# EasyEDA Pro project TMI7003C_TEST.eprj

# Schematic Schematic1

## Sheets
1 P1: Board Name: Board1; Create Date: 2025-01-24; Page Name: P1; Project Name: TMI7003C_TEST; Schematic Name: Schematic1; Update Date: 2025-01-25; Company: 嘉立创EDA; Page Size: A4; Version: V1.0
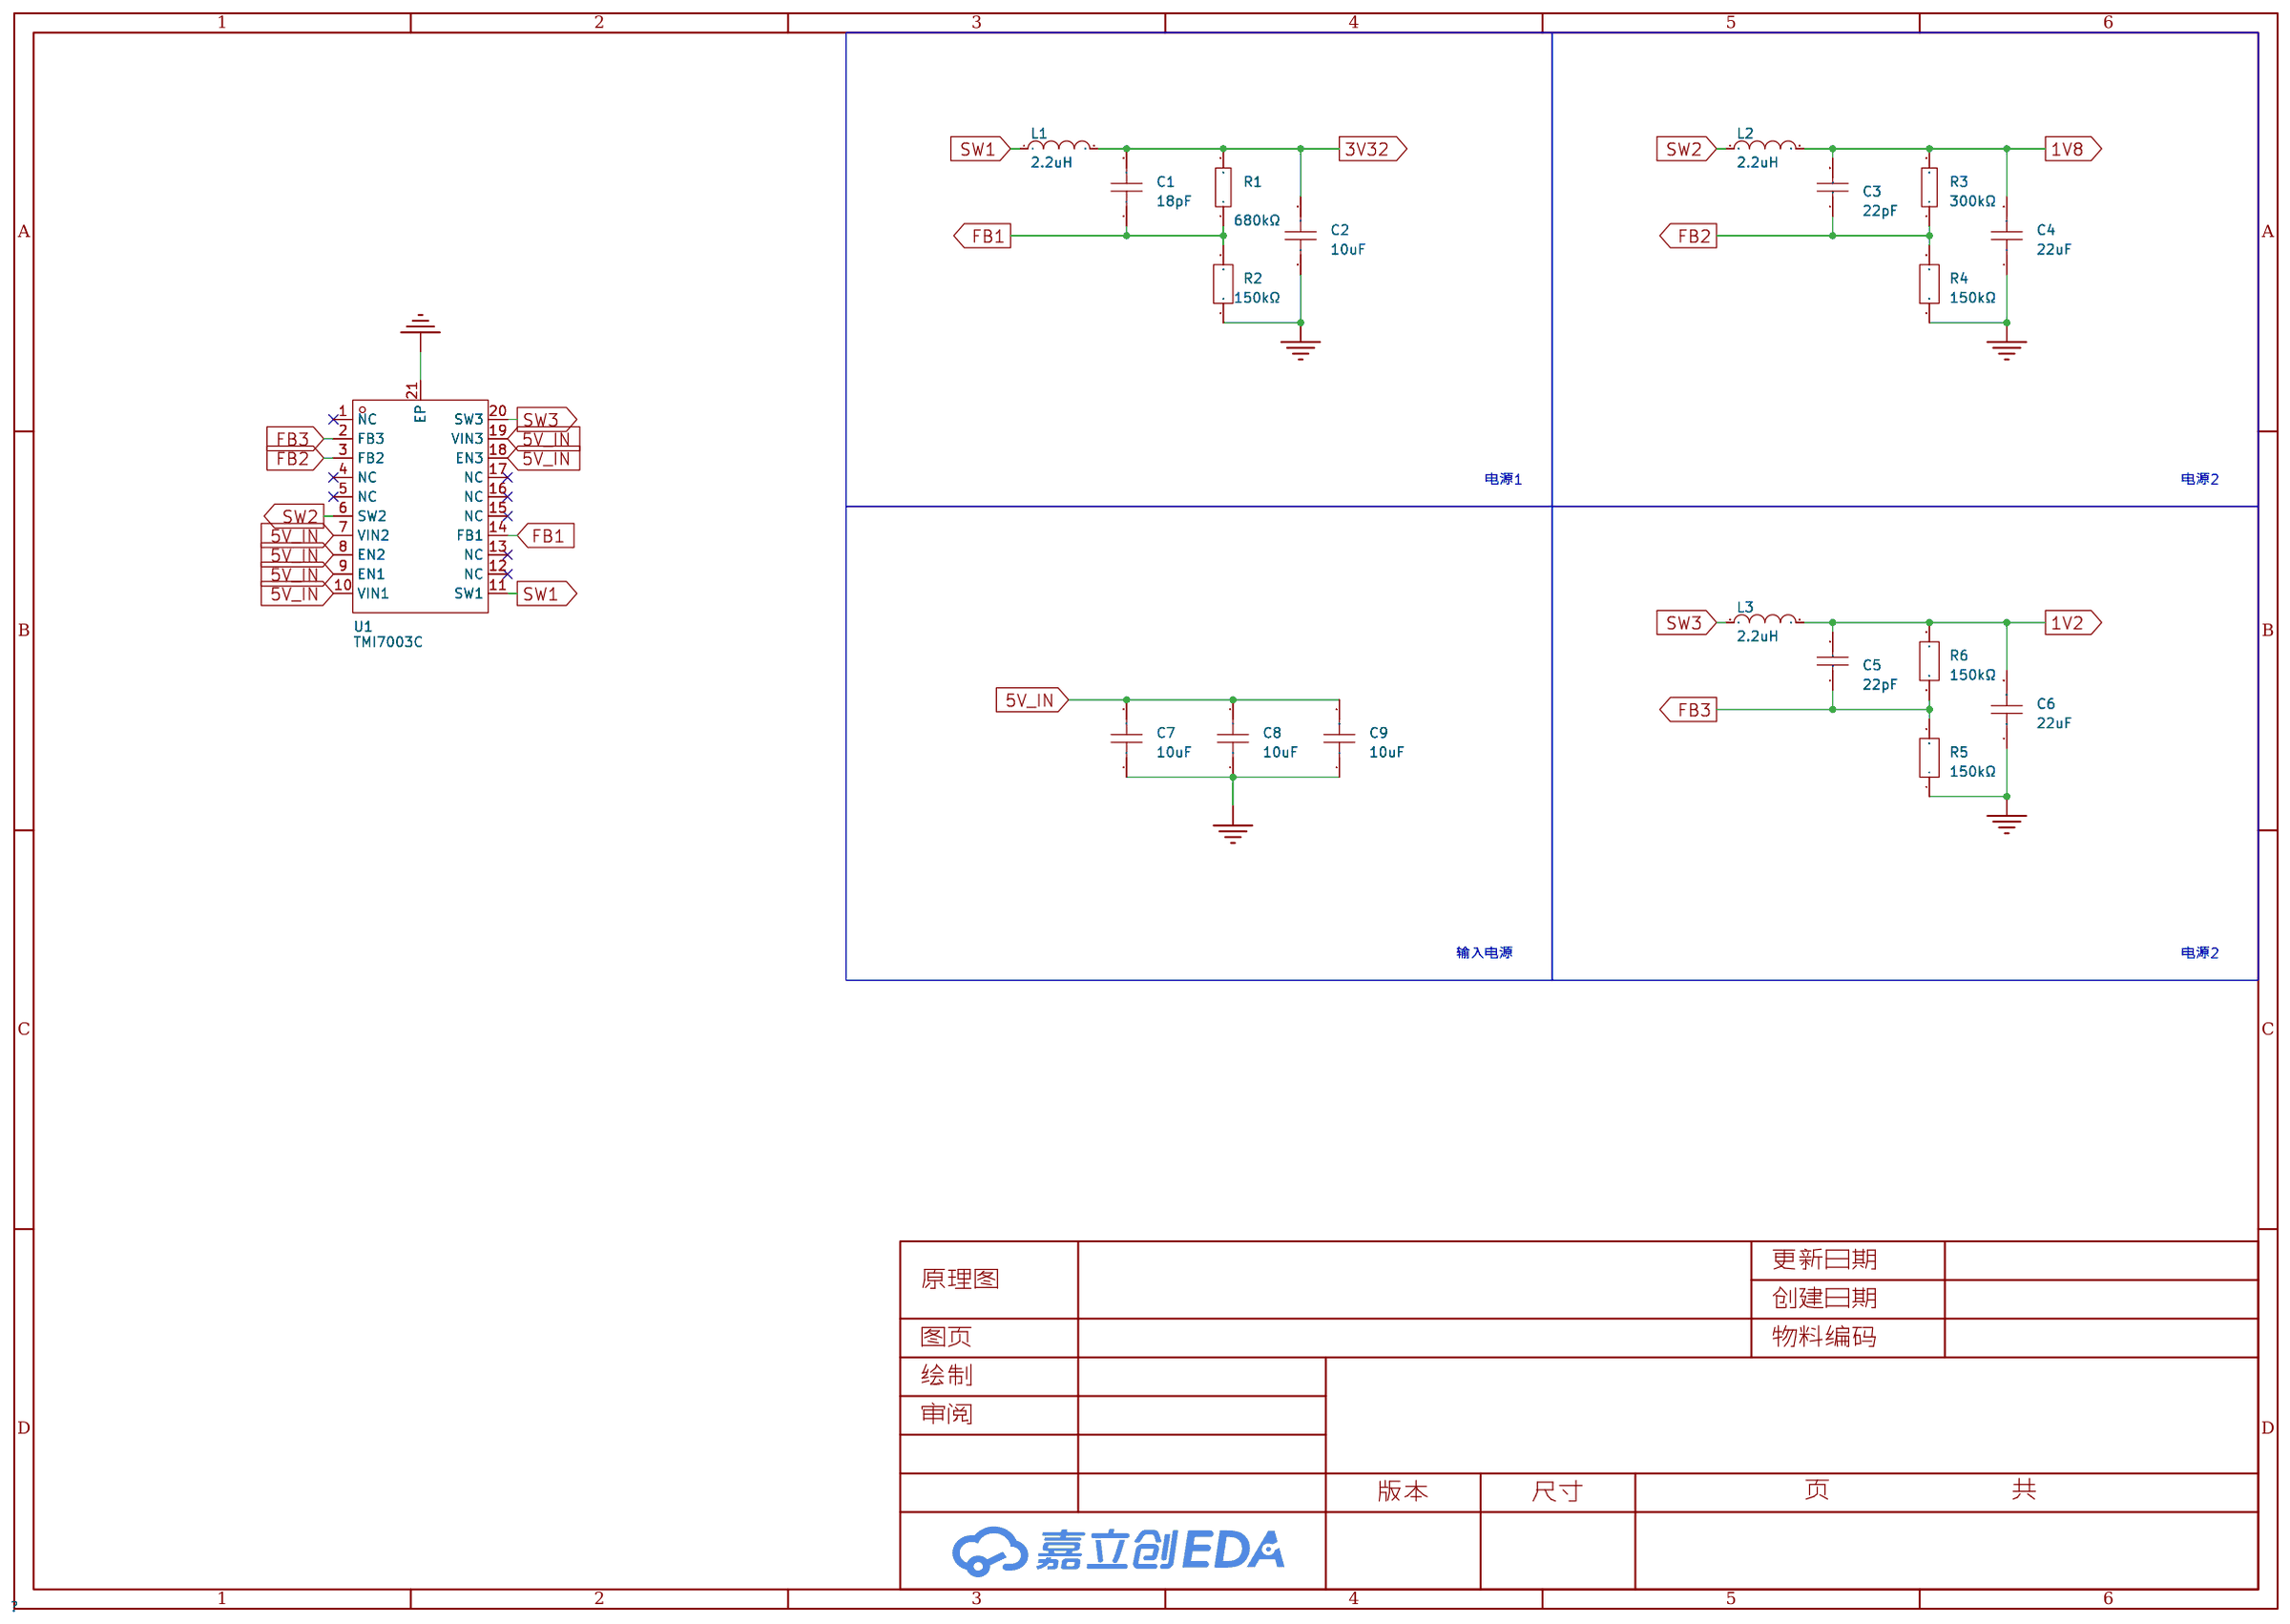
[diagram p0: P1]
2 P2: Create Date: 2025-01-25; Page Name: P2
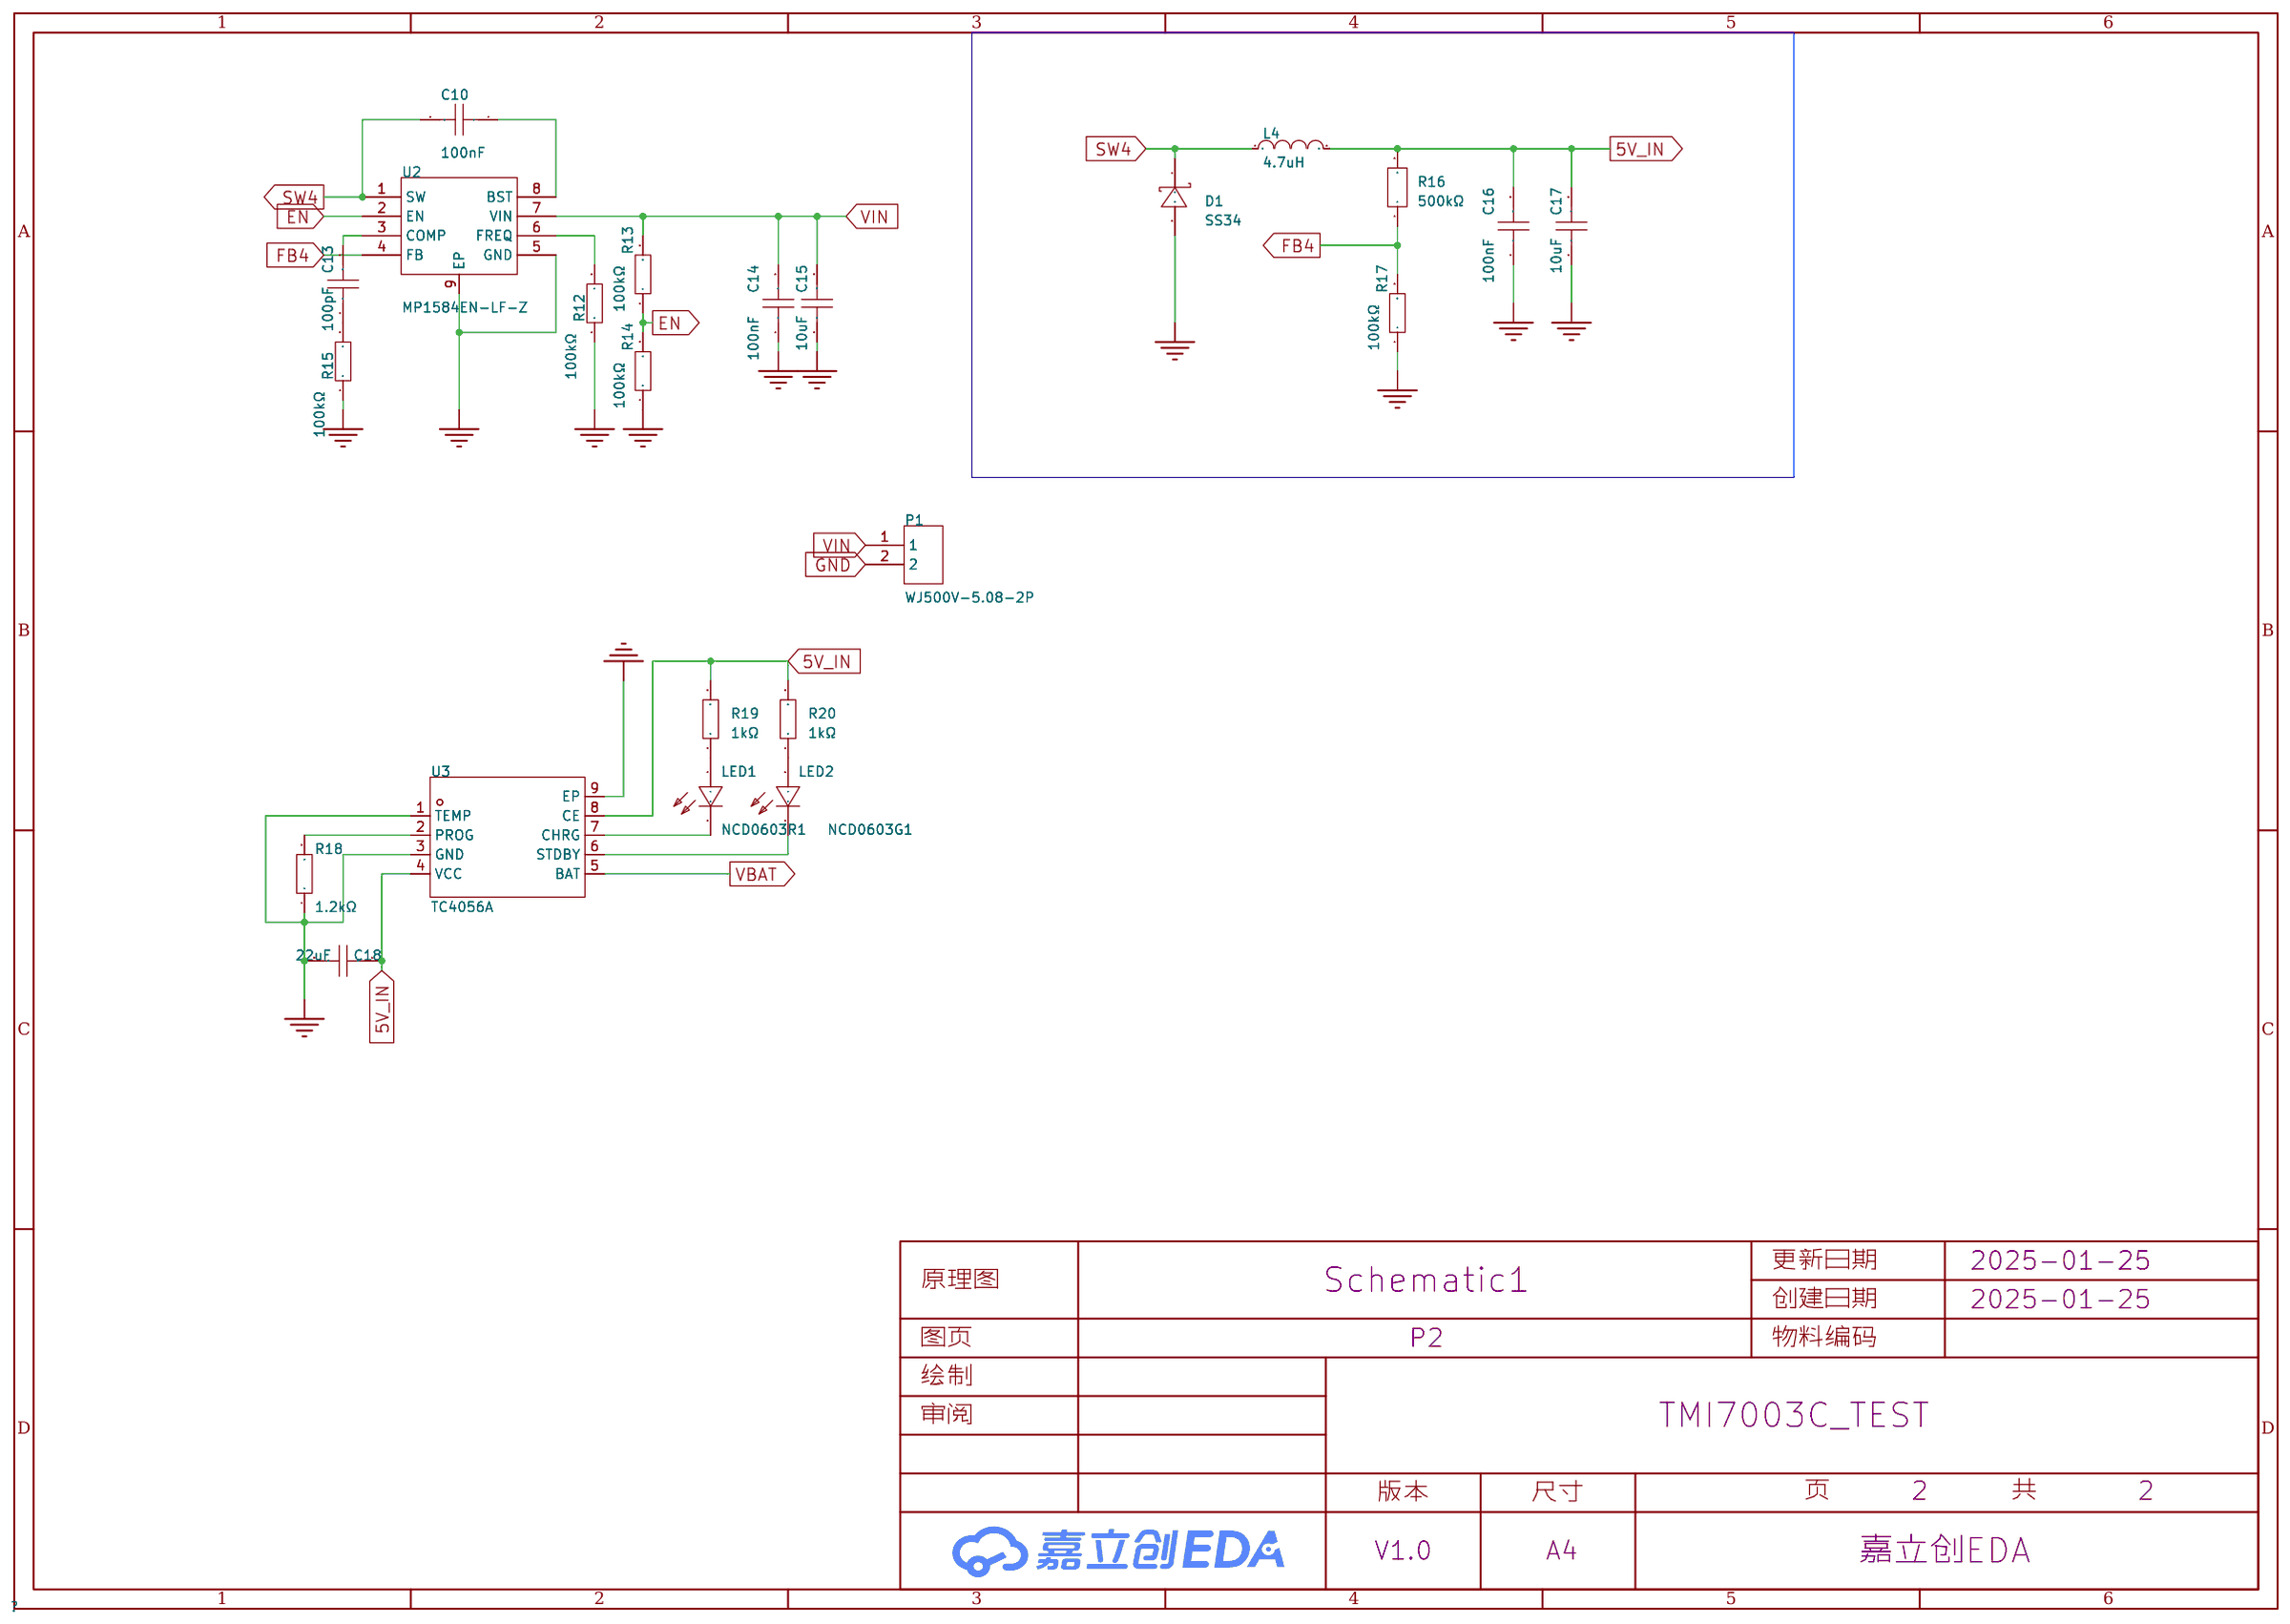
[diagram p1: P2]

## Parts
sheet P1
C1  18pF  [C0603]
C2  10uF  [C0603]
C3  22pF  [C0603]
C4  22uF  [C0805]
C5  22pF  [C0603]
C6  22uF  [C0805]
C7  10uF  [C0603]
C8  10uF  [C0603]
C9  10uF  [C0603]
L1  2.2uH  [IND-SMD_L2.5-W2.0_MHCHL2520]
L2  2.2uH  [IND-SMD_L2.5-W2.0_MHCHL2520]
L3  2.2uH  [IND-SMD_L2.5-W2.0_MHCHL2520]
R1  680kΩ  [R0603]
R2  150kΩ  [R0603]
R3  300kΩ  [R0603]
R4  150kΩ  [R0603]
R5  150kΩ  [R0603]
R6  150kΩ  [R0603]
U1  TMI7003C  [QFN-20_L3.0-W3.0-P0.40-BL-EP1.9]
sheet P2
C10  100nF  [C0603]
C13  100pF  [C0603]
C14  100nF  [C0603]
C15  10uF  [C0603]
C16  100nF  [C0603]
C17  10uF  [C0603]
C18  22uF  [C0805]
D1  SS34  [SMA_L4.3-W2.6-LS5.2-RD]
L4  4.7uH  [IND-SMD_L5.4-W5.2_FXL0530]
LED1  NCD0603R1  [LED0603-RD_RED]
LED2  NCD0603G1  [LED0603-RD_1]
P1  WJ500V-5.08-2P  [CONN-TH_2P-P5.00_WJ500V-5.08-2P]
R12  100kΩ  [R0603]
R13  100kΩ  [R0603]
R14  100kΩ  [R0603]
R15  100kΩ  [R0603]
R16  500kΩ  [R0603]
R17  100kΩ  [R0603]
R18  1.2kΩ  [R0603]
R19  1kΩ  [R0603]
R20  1kΩ  [R0603]
U2  MP1584EN-LF-Z  [SOIC-8_L5.0-W4.0-P1.27-LS6.0-BL-EP2.0]
U3  TC4056A  [ESOP-8_L4.9-W3.9-P1.27-LS6.0-BR-EP3.3]

## Library data of the parts
C1 = FCC0603N180J500CT: 容值:18pF;精度:±5%;额定电压:50V;材质(温度系数):C0G;; LCSC Part Name: 18pF ±5% 50V; Supplier Part: C5137620; Manufacturer: FOJAN(富捷); Supplier Footprint: 0603; JLCPCB Part Class: 扩展库; Datasheet: https://atta.szlcsc.com/upload/public/pdf/source/20220818/0EB3B7FB2F5648AC16609637FBA7DABE.pdf; Supplier: LCSC; Tolerance: ±5%; Voltage Rated: 50V; Temperature Coefficient: C0G
C2 C7-C9 C15 C17 = CGA0603X5R106K100JT: 容值:10uF;精度:±10%;额定电压:10V;材质(温度系数):X5R;; LCSC Part Name: 10uF ±10% 10V; Supplier Part: C6119842; Manufacturer: HRE(芯声); Supplier Footprint: 0603; JLCPCB Part Class: 扩展库; Supplier: LCSC; Tolerance: ±10%; Voltage Rated: 10V; Temperature Coefficient: X5R
C3 = CC0603JRNPO9BN220: 容值:22pF;精度:±5%;额定电压:50V;材质(温度系数):NP0;; LCSC Part Name: 22pF ±5% 50V; Supplier Part: C105620; Manufacturer: YAGEO(国巨); Supplier Footprint: 0603; JLCPCB Part Class: 扩展库; Datasheet: https://atta.szlcsc.com/upload/public/pdf/source/20170505/1493957838062.pdf; Supplier: LCSC; Tolerance: ±5%; Voltage Rated: 50V; Temperature Coefficient: NP0
C4 C6 C18 = CGA0805X5R226M350MT: 容值:22uF;精度:±20%;额定电压:35V;材质(温度系数):X5R;; LCSC Part Name: 22uF ±20% 35V; Supplier Part: C6119901; Manufacturer: HRE(芯声); Supplier Footprint: 0805; JLCPCB Part Class: 扩展库; Datasheet: https://atta.szlcsc.com/upload/public/pdf/source/20231129/D589D0CC4D260F7AC3A77E53B455CCB3.pdf; Supplier: LCSC; Tolerance: ±20%; Voltage Rated: 35V; Temperature Coefficient: X5R
C5 = CC0603JRNPO9BN220: 容值:22pF;精度:±5%;额定电压:50V;材质(温度系数):NP0;; LCSC Part Name: 22pF ±5% 50V; Supplier Part: C105620; Manufacturer: YAGEO(国巨); Supplier Footprint: 0603; JLCPCB Part Class: Extended Part; Datasheet: https://atta.szlcsc.com/upload/public/pdf/source/20170505/1493957838062.pdf; Supplier: LCSC; Tolerance: ±5%; Voltage Rated: 50V; Temperature Coefficient: NP0
L1-L3 = FTC252012S2R2MBCA: 电感值:2.2uH;精度:±20%;额定电流:3A;饱和电流(Isat):3.8A;类型:一体成型电感;; LCSC Part Name: 2.2uH ±20% 3.8A; Supplier Part: C5832372; Manufacturer: cjiang(长江微电); Supplier Footprint: 1008; JLCPCB Part Class: 扩展库; Datasheet: https://atta.szlcsc.com/upload/public/pdf/source/20230602/8FFEDA9C0247A92A0D4B67554BFE4091.pdf; Supplier: LCSC; Tolerance: ±20%; Rated Current: 3A; Saturation Current (Isat): 3.8A; DC Resistance (DCR): 55mΩ; Type: 一体成型电感
R1 = 0603WAF6803T5E: 电阻类型:厚膜电阻;阻值:680kΩ;精度:±1%;功率:100mW;最大工作电压:75V;温度系数:±100ppm/℃;; LCSC Part Name: 680kΩ ±1% 100mW 厚膜电阻; Supplier Part: C25822; Manufacturer: UNI-ROYAL(厚声); Supplier Footprint: 0603; JLCPCB Part Class: 扩展库; Datasheet: https://atta.szlcsc.com/upload/public/pdf/source/20200306/C422600_1E6D84923E4A46A82E41ADD87F860B5C.pdf; Supplier: LCSC; Type: 厚膜电阻; Tolerance: ±1%; Power(Watts): 100mW; Overload Voltage (Max): 75V; Temperature Coefficient: ±100ppm/℃; Operating Temperature Range: -55℃~+155℃
R2 R4-R6 = FRC0603F1503TS: 电阻类型:厚膜电阻;阻值:150kΩ;精度:±1%;功率:100mW;最大工作电压:75V;温度系数:±100ppm/℃;; LCSC Part Name: 150kΩ ±1% 100mW 厚膜电阻; Supplier Part: C2906993; Manufacturer: FOJAN(富捷); Supplier Footprint: 0603; JLCPCB Part Class: 扩展库; Datasheet: https://atta.szlcsc.com/upload/public/pdf/source/20211221/925EC7D7225764EE0046F22065062C87.pdf; Supplier: LCSC; Type: 厚膜电阻; Tolerance: ±1%; Power(Watts): 100mW; Overload Voltage (Max): 75V; Temperature Coefficient: ±100ppm/℃; Operating Temperature Range: -55℃~+155℃
R3 = 0603WAF3003T5E: 电阻类型:厚膜电阻;阻值:300kΩ;精度:±1%;功率:100mW;最大工作电压:75V;温度系数:±100ppm/℃;; LCSC Part Name: 300kΩ ±1% 100mW 厚膜电阻; Supplier Part: C23024; Manufacturer: UNI-ROYAL(厚声); Supplier Footprint: 0603; JLCPCB Part Class: 基础库; Datasheet: https://atta.szlcsc.com/upload/public/pdf/source/20200306/C422600_1E6D84923E4A46A82E41ADD87F860B5C.pdf; Supplier: LCSC; Type: 厚膜电阻; Tolerance: ±1%; Power(Watts): 100mW; Overload Voltage (Max): 75V; Temperature Coefficient: ±100ppm/℃; Operating Temperature Range: -55℃~+155℃
U1 = TMI7003C: 功能类型:降压型;输出类型:-;工作电压:2.5V~5.5V;输出电压:-;输出电流:-;; LCSC Part Name: 3通道1.5A 1.5MHz同步降压电源管理IC; Supplier Part: C840566; Manufacturer: TMI(拓尔微); Supplier Footprint: QFN-20-EP(3x3); JLCPCB Part Class: 扩展库; Datasheet: https://atta.szlcsc.com/upload/public/pdf/source/20240902/914C742CD42C12243EC1254263C971AB.pdf; Supplier: LCSC; Function: 降压型; Input Voltage: 2.5V~5.5V; Switching Frequency: 1.5MHz; Operating Temperature: -40℃~+125℃; Topology: 降压式
C10 C14 C16 = CGA0603X7R104K500JT: 容值:100nF;精度:±10%;额定电压:50V;材质(温度系数):X7R;; LCSC Part Name: 100nF ±10% 50V; Supplier Part: C6119867; Manufacturer: HRE(芯声); Supplier Footprint: 0603; JLCPCB Part Class: 扩展库; Supplier: LCSC; Tolerance: ±10%; Voltage Rated: 50V; Temperature Coefficient: X7R
C13 = CC0603JRNPO9BN101: 容值:100pF;精度:±5%;额定电压:50V;材质(温度系数):NP0;; LCSC Part Name: 100pF ±5% 50V; Supplier Part: C14665; Manufacturer: YAGEO(国巨); Supplier Footprint: 0603; JLCPCB Part Class: 扩展库; Datasheet: https://atta.szlcsc.com/upload/public/pdf/source/20181008/C309499_21CC21451B82C39E3D92150FD6B30293.pdf; Supplier: LCSC; Tolerance: ±5%; Voltage Rated: 50V; Temperature Coefficient: NP0
D1 = SS34_C8678: 二极管配置:独立式;正向压降(Vf):550mV@3A;直流反向耐压(Vr):40V;整流电流:3A;; LCSC Part Name: 电压:40V 电流:3A; Supplier Part: C8678; Manufacturer: MDD(辰达半导体); Supplier Footprint: SMA(DO-214AC); JLCPCB Part Class: 基础库; Datasheet: https://atta.szlcsc.com/upload/public/pdf/source/20240710/2118BB86FDDB2E0B294389AC1F3F65C8.pdf; Supplier: LCSC; Diode Configuration: 独立式; Forward Voltage (Vf@If): 550mV@3A; Reverse Voltage (Vr): 40V; Rectified Current: 3A; Reverse Leakage Current (Ir): 500uA@40V
L4 = FXL0530-4R7-M: 电感值:4.7uH;精度:±20%;额定电流:4.5A;饱和电流(Isat):5A;类型:一体成型电感;; LCSC Part Name: 4.7uH ±20% 5A; Supplier Part: C177246; Manufacturer: cjiang(长江微电); Supplier Footprint: SMD,5.2x5.4mm; JLCPCB Part Class: 扩展库; Datasheet: https://atta.szlcsc.com/upload/public/pdf/source/20240426/3189EA8206330E2108542F9E34E540E7.pdf; Supplier: LCSC; Tolerance: ±20%; Rated Current: 4.5A; Saturation Current (Isat): 5A; DC Resistance (DCR): 60mΩ; Type: 一体成型电感
LED1 = NCD0603R1_C84263: 灯头类型:-;发光颜色:红色;正向电压(VF):1.6V~2.6V;功率:65mW;正向电流:20mA;主波长:615nm~630nm;二极管配置:独立二极管;透镜颜色:无色透明透镜;色温:-;发光强度:80mcd~220mcd;发光角度:130°;载带方式:-;工作温度:-30℃~+85℃;; Supplier Part: C84263; Manufacturer: 国星光电; Supplier Footprint: 0603; JLCPCB Part Class: 扩展库; Datasheet: https://atta.szlcsc.com/upload/public/pdf/source/20200820/C84263_DABC6A75E58F576973B407FDBA283D60.pdf; Supplier: LCSC; Emitted Color: 红色; Forward Voltage (VF): 1.6V~2.6V; Power Dissipation: 65mW; Forward Current: 20mA; Dominant Wavelength: 615nm~630nm; Diode Configuration: 独立二极管; Lens Color: 无色透明透镜; Luminous Intensity: 80mcd~220mcd; Viewing Angle: 130°; Operating Temperature: -30℃~+85℃
LED2 = NCD0603G1: 发光颜色:翠绿色;正向电压(VF):2.6V~3.6V;功率:72mW;正向电流:10mA;主波长:515nm~530nm;透镜颜色:无色透明透镜;发光强度:330mcd~900mcd;发光角度:130°;工作温度:-30℃~+85℃;; Supplier Part: C84267; Manufacturer: 国星光电; Supplier Footprint: 0603; JLCPCB Part Class: 扩展库; Datasheet: https://atta.szlcsc.com/upload/public/pdf/source/20200820/C84267_04BA7703640BAC111D09F5EFB971FBF3.pdf; Supplier: LCSC; Emitted Color: 翠绿色; Forward Voltage (VF): 2.6V~3.6V; Power Dissipation: 72mW; Forward Current: 10mA; Dominant Wavelength: 515nm~530nm; Lens Color: 无色透明透镜; Luminous Intensity: 330mcd~900mcd; Viewing Angle: 130°; Operating Temperature: -30℃~+85℃
P1 = WJ500V-5.08-2P: 结构:1x2P;间距:5.08mm;颜色:绿色;安装方式:直插;额定电流:18A;额定电压:250V;排数:1;线规 - AWG:14~30;线规 - 平方毫米:2.5;每排PIN数:2;触头材质:-;触头镀层:-;工作温度范围:-40℃~+105℃;焊接温度(最大值):-;; LCSC Part Name: 1x2P 5.08mm 直插 排数:1 每排P数:2; Supplier Part: C8465; Manufacturer: KANGNEX(康奈克斯电气); Supplier Footprint: 插件,P=5.08mm; JLCPCB Part Class: 扩展库; Datasheet: https://atta.szlcsc.com/upload/public/pdf/source/20191225/C8465_02D34CE5B5B4A53DF5891601D97FA9F4.pdf; Supplier: LCSC; Structure: 1x2P; Pitch: 5.08mm; Color: 绿色; Mounting Style: 直插; Current Rating (Max): 18A; Voltage Rating (Max): 250V; Number of Pins: 2P; Number of Rows: 1; Wire Gauge - AWG: 14~30; Wire Gauge - mm2: 2.5; Number of PINs Per Row: 2; Operating Temperature Range: -40℃~+105℃; Screw Specification: M2.5
R12-R15 R17 = 0603WAF1003T5E: 电阻类型:厚膜电阻;阻值:100kΩ;精度:±1%;功率:100mW;最大工作电压:75V;温度系数:±100ppm/℃;; LCSC Part Name: 100kΩ ±1% 100mW 厚膜电阻; Supplier Part: C25803; Manufacturer: UNI-ROYAL(厚声); Supplier Footprint: 0603; JLCPCB Part Class: 基础库; Datasheet: https://atta.szlcsc.com/upload/public/pdf/source/20200306/C422600_1E6D84923E4A46A82E41ADD87F860B5C.pdf; Supplier: LCSC; Type: 厚膜电阻; Tolerance: ±1%; Power(Watts): 100mW; Overload Voltage (Max): 75V; Temperature Coefficient: ±100ppm/℃; Operating Temperature Range: -55℃~+155℃
R16 = AR03BTC5003N: 阻值:500kΩ;精度:±0.1%;功率:62.5mW;温度系数:±25ppm/℃;; LCSC Part Name: 500kΩ ±0.1% 62.5mW; Supplier Part: C412382; Manufacturer: Viking(光颉); Supplier Footprint: 0603; JLCPCB Part Class: 扩展库; Datasheet: https://atta.szlcsc.com/upload/public/pdf/source/20191129/C465721_10D49275DB41E427863CE9C8D788770A.pdf; Supplier: LCSC; Tolerance: ±0.1%; Power(Watts): 62.5mW; Temperature Coefficient: ±25ppm/℃
R18 = 0603WAF1201T5E: 电阻类型:厚膜电阻;阻值:1.2kΩ;精度:±1%;功率:100mW;最大工作电压:75V;温度系数:±100ppm/℃;; LCSC Part Name: 1.2kΩ ±1% 100mW 厚膜电阻; Supplier Part: C22765; Manufacturer: UNI-ROYAL(厚声); Supplier Footprint: 0603; JLCPCB Part Class: 基础库; Datasheet: https://atta.szlcsc.com/upload/public/pdf/source/20200306/C422600_1E6D84923E4A46A82E41ADD87F860B5C.pdf; Supplier: LCSC; Type: 厚膜电阻; Tolerance: ±1%; Power(Watts): 100mW; Overload Voltage (Max): 75V; Temperature Coefficient: ±100ppm/℃; Operating Temperature Range: -55℃~+155℃
R19 R20 = 0603WAF1001T5E: 电阻类型:厚膜电阻;阻值:1kΩ;精度:±1%;功率:100mW;最大工作电压:75V;温度系数:±100ppm/℃;; LCSC Part Name: 1kΩ ±1% 100mW 厚膜电阻; Supplier Part: C21190; Manufacturer: UNI-ROYAL(厚声); Supplier Footprint: 0603; JLCPCB Part Class: 基础库; Datasheet: https://atta.szlcsc.com/upload/public/pdf/source/20200306/C422600_1E6D84923E4A46A82E41ADD87F860B5C.pdf; Supplier: LCSC; Type: 厚膜电阻; Tolerance: ±1%; Power(Watts): 100mW; Overload Voltage (Max): 75V; Temperature Coefficient: ±100ppm/℃; Operating Temperature Range: -55℃~+155℃
U2 = MP1584EN-LF-Z: 功能类型:降压型;输出类型:固定;工作电压:4.5V~28V;输出电压:800mV~25V;输出电流:3A;; LCSC Part Name: 3A、1.5MHz、28V降压转换器; Supplier Part: C15051; Manufacturer: MPS(芯源); Supplier Footprint: SOIC-8-EP; JLCPCB Part Class: 扩展库; Datasheet: https://atta.szlcsc.com/upload/public/pdf/source/20240315/437CA6FCECC7F1E554266F7D3B71CA0D.pdf; Supplier: LCSC; Function: 降压型; Output Type: 固定; Input Voltage: 4.5V~28V; Output Voltage: 800mV~25V; Output Current: 3A; Switching Frequency: 100kHz~1.5MHz; Operating Temperature: -20℃~+125℃; Synchronous Rectification: 否; Number of Outputs: 1; Topology: 降压式; Quiescent Current (Iq): 100uA; Switch tube (built-in/external): 内置
U3 = TC4056A: 锂电池1A充电; LCSC Part Name: A档; Supplier Part: C84051; Manufacturer: FM(富满); Supplier Footprint: SOP-8-EP; JLCPCB Part Class: 扩展库; Datasheet: https://atta.szlcsc.com/upload/public/pdf/source/20241210/75A3BB1B55B92B4C46ED3BBA4FF28CC0.pdf; Supplier: LCSC

## Nets
1V2: C5.2 C6.2 L3.2 R6.2
1V8: C3.2 C4.2 L2.2 R3.2
3V32: C1.2 C2.2 L1.2 R1.2
5V_IN: C7.2 C8.2 C9.2 C16.2 C17.2 C18.1 L4.2 R16.2 R19.2 R20.2 U1.7(VIN2) U1.8(EN2) U1.9(EN1) U1.10(VIN1) U1.18(EN3) U1.19(VIN3) U3.4(VCC) U3.8(CE)
GND: C2.1 C4.1 C6.1 C7.1 C8.1 C9.1 C14.1 C15.1 C16.1 C17.1 C18.2 D1.2(A) P1.2 R2.1 R4.1 R5.1 R12.1 R14.1 R15.1 R17.1 R18.1 U1.21(EP) U2.5(GND) U2.9(EP) U3.1(TEMP) U3.3(GND) U3.9(EP)
VBAT: U3.5(BAT)
VIN: C14.2 C15.2 P1.1 R13.2 U2.7(VIN)
EN: R13.1 R14.2 U2.2(EN)
FB1: C1.1 R1.1 R2.2 U1.14(FB1)
FB2: C3.1 R3.1 R4.2 U1.3(FB2)
FB3: C5.1 R5.2 R6.1 U1.2(FB3)
FB4: R16.1 R17.2 U2.4(FB)
SW1: L1.1 U1.11(SW1)
SW2: L2.1 U1.6(SW2)
SW3: L3.1 U1.20(SW3)
SW4: C10.2 D1.1(K) L4.1 U2.1(SW)
$2N216: C10.1 U2.8(BST)
$2N507: R12.2 U2.6(FREQ)
$2N1682: C13.1 R15.2
$2N1720: C13.2 U2.3(COMP)
$2N3676: R18.2 U3.2(PROG)
$2N3989: LED1.1(K) U3.7(CHRG)
$2N3992: LED2.1(K) U3.6(STDBY)
$2N4031: LED1.2(A) R19.1
$2N4070: LED2.2(A) R20.1

Not connected (* = marked no-connect by the designer): U1 1(NC)* 4(NC)* 5(NC)* 12(NC)* 13(NC)* 15(NC)* 16(NC)* 17(NC)*

## Notes on the sheets
sheet 1
- 电源1
- 电源2
- 输入电源
- 电源2

# Board PCB1
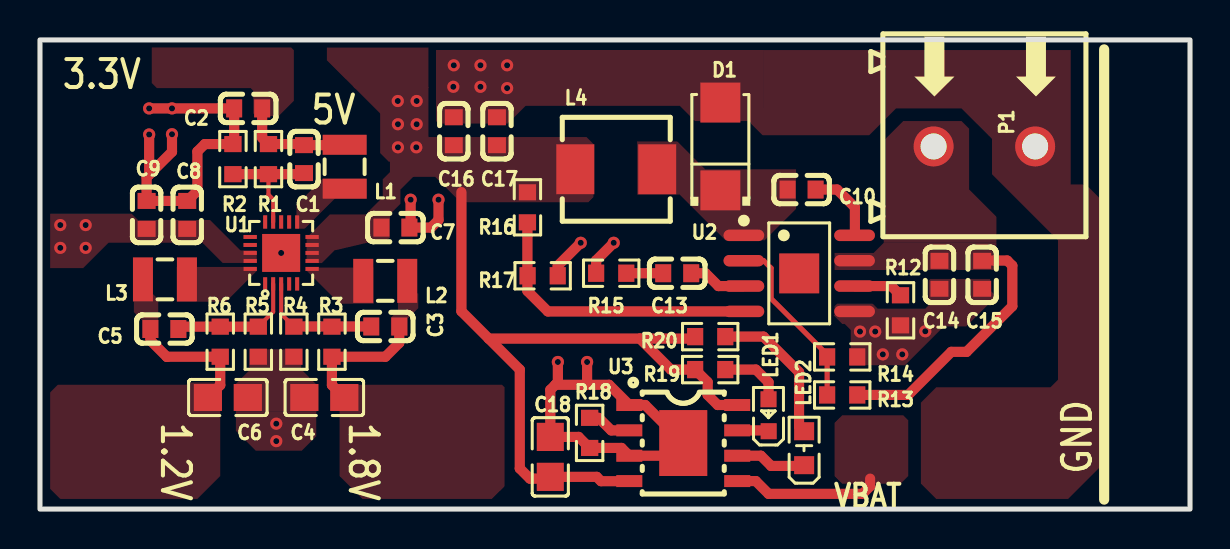
[diagram p2: board, top side]
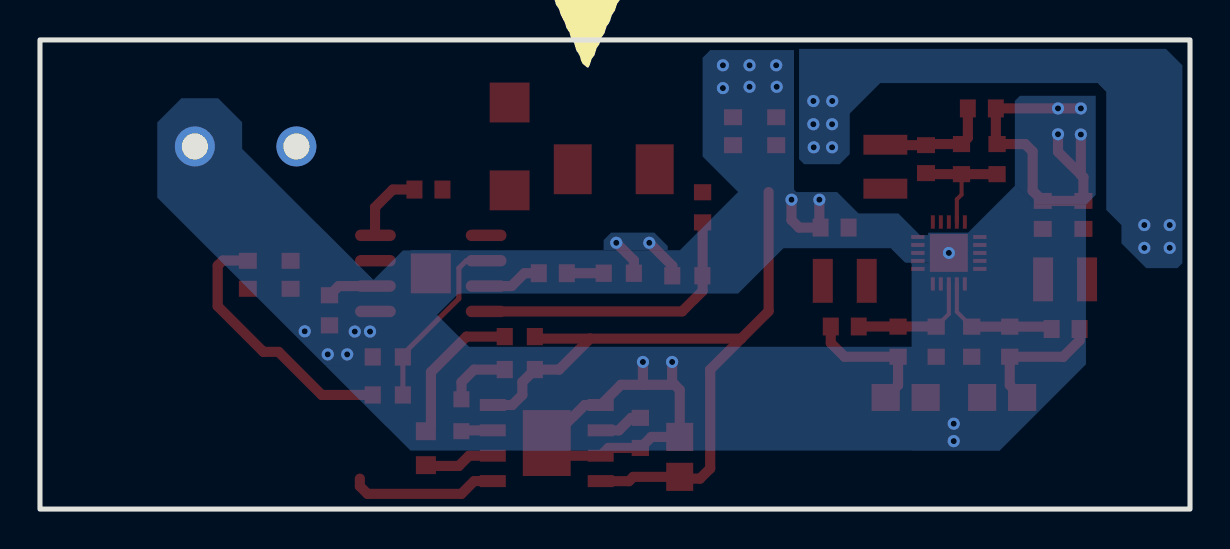
[diagram p3: board, bottom side, seen from below]

Outline 57.53 x 23.5 mm; copper layers: Top Layer, Bottom Layer. Coordinates in mm from the lower left corner of the outline.
Outline path: rectangle 0,23.5 57.53,0
Stack: Top Layer 0.035mm / Dielectric1 1.51mm FR4 er 4.5 / Bottom Layer 0.035mm

## Design rules (mm)
template: JLCPCB Capability(Two Layers Board)
spacing copperThickness1oz (default): track to track 0.102, other pairs 0.152 to 0.3
spacing copperThickness2oz: track to track 0.203, other pairs 0.152 to 0.3
track width copperThickness1oz (default): min 0.127, default 0.254, max 2.54
track width copperThickness2oz: min 0.203, default 0.254, max 2.54
differential pair differentialPair (default): width min 0.127, default 0.254, max 2.54; gap min 0.152, default 0.152
via viaSize (default): diameter min 0.5, default 0.61, max 10; hole min 0.3, default 0.305, max 6.3

## Placement (name value [footprint] x y rotation side)
C1  18pF  [C0603]  13.21 17.53 90 top
C2  10uF  [C0603]  10.41 20.07 0 top
C3  22pF  [C0603]  17.27 9.14 0 top
C4  22uF  [C0805]  14.22 5.59 0 top
C5  22pF  [C0603]  6.22 9.02 180 top
C6  22uF  [C0805]  9.4 5.59 180 top
C7  10uF  [C0603]  17.78 14.1 180 top
C8  10uF  [C0603]  7.37 14.73 270 top
C9  10uF  [C0603]  5.33 14.73 270 top
C10  100nF  [C0603]  38.1 16 180 top
C13  100pF  [C0603]  31.88 11.81 0 top
C14  100nF  [C0603]  45 11.73 90 top
C15  10uF  [C0603]  47.13 11.73 90 top
C16  100nF  [C0603]  20.7 18.92 270 top
C17  10uF  [C0603]  22.86 18.92 270 top
C18  22uF  [C0805]  25.53 2.61 90 top
D1  SS34  [SMA_L4.3-W2.6-LS5.2-RD]  34.04 18.16 90 top
L1  2.2uH  [IND-SMD_L2.5-W2.0_MHCHL2520]  15.24 17.15 90 top
L2  2.2uH  [IND-SMD_L2.5-W2.0_MHCHL2520]  17.27 11.43 0 top
L3  2.2uH  [IND-SMD_L2.5-W2.0_MHCHL2520]  6.25 11.5 180 top
L4  4.7uH  [IND-SMD_L5.4-W5.2_FXL0530]  28.83 17.02 180 top
LED1  NCD0603R1  [LED0603-RD_RED]  36.45 4.7 90 top
LED2  NCD0603G1  [LED0603-RD_1]  38.23 3.05 90 top
P1  WJ500V-5.08-2P  [CONN-TH_2P-P5.00_WJ500V-5.08-2P]  47.24 18.16 0 top
R1  680kΩ  [R0603]  11.43 17.53 90 top
R2  150kΩ  [R0603]  9.65 17.53 270 top
R3  300kΩ  [R0603]  14.6 8.38 270 top
R4  150kΩ  [R0603]  12.7 8.38 90 top
R5  150kΩ  [R0603]  10.92 8.38 90 top
R6  150kΩ  [R0603]  9.02 8.38 270 top
R12  100kΩ  [R0603]  43.05 9.95 90 top
R13  100kΩ  [R0603]  40.13 5.72 0 top
R14  100kΩ  [R0603]  40.13 7.62 180 top
R15  100kΩ  [R0603]  28.57 11.81 0 top
R16  500kΩ  [R0603]  24.38 15.11 90 top
R17  100kΩ  [R0603]  25.15 11.68 180 top
R18  1.2kΩ  [R0603]  27.5 3.81 90 top
R19  1kΩ  [R0603]  33.53 6.98 180 top
R20  1kΩ  [R0603]  33.53 8.64 180 top
U1  TMI7003C  [QFN-20_L3.0-W3.0-P0.40-BL-EP1.9]  12.06 12.83 0 top
U2  MP1584EN-LF-Z  [SOIC-8_L5.0-W4.0-P1.27-LS6.0-BL-EP2.0]  37.98 11.8 270 top
U3  TC4056A  [ESOP-8_L4.9-W3.9-P1.27-LS6.0-BR-EP3.3]  32.18 3.31 180 top

## Footprints (pads in the part's own frame, mm; a bottom-side part is the same pattern mirrored in y, then rotated)
C0603
  rect 0.8x0.9 smd: 1(-0.7,0) 2(0.7,0)
C0805
  rect 1.41x1.35 smd: 1(-1,0) 2(1,0)
CONN-TH_2P-P5.00_WJ500V-5.08-2P
  round 2 hole 1.3: 1(-2.54,0) 2(2.54,0)
ESOP-8_L4.9-W3.9-P1.27-LS6.0-BR-EP3.3
  rect 1.3x0.6 smd: 1(2.7,-1.905) 2(2.7,-0.635) 3(2.7,0.635) 4(2.7,1.905) 5(-2.7,1.905) 6(-2.7,0.635) 7(-2.7,-0.635) 8(-2.7,-1.905)
  rect 2.4x3.3 smd: 9(0,0)
IND-SMD_L2.5-W2.0_MHCHL2520
  rect 1x2.2 smd: 1(-1.1,0) 2(1.1,0)
IND-SMD_L5.4-W5.2_FXL0530
  rect 1.9x2.5 smd: 1(-2.05,0) 2(2.05,0)
LED0603-RD_1
  rect 0.9x1 smd: 1(-0.85,0) 2(0.85,0)
LED0603-RD_RED
  rect 0.8x0.8 smd: 1(-0.799,-0.004) 2(0.799,0.004)
QFN-20_L3.0-W3.0-P0.40-BL-EP1.9
  rect 0.2x0.665 smd: 1(-0.8,-1.55) 2(-0.4,-1.55) 3(0,-1.55) 4(0.4,-1.55) 5(0.8,-1.55) 11(0.8,1.55) 12(0.4,1.55) 13(0,1.55) 14(-0.4,1.55) 15(-0.8,1.55)
  rect 0.665x0.2 smd: 6(1.55,-0.8) 7(1.55,-0.4) 8(1.55,0) 9(1.55,0.4) 10(1.55,0.8) 16(-1.55,0.8) 17(-1.55,0.4) 18(-1.55,0) 19(-1.55,-0.4) 20(-1.55,-0.8)
  rect 1.9x1.9 smd: 21(0,0)
R0603
  rect 0.806x0.864 smd: 1(-0.753,0) 2(0.753,0)
SMA_L4.3-W2.6-LS5.2-RD
  rect 2x2 smd: 1(-2.2,0) 2(2.2,0)
SOIC-8_L5.0-W4.0-P1.27-LS6.0-BL-EP2.0
  oval 0.574x2.038 smd: 1(-1.905,-2.769) 2(-0.635,-2.769) 3(0.635,-2.769) 4(1.905,-2.769) 5(1.905,2.769) 6(0.635,2.769) 7(-0.635,2.769) 8(-1.905,2.769)
  rect 2x2 smd: 9(0,0)

## Nets
As in the schematic.

Pads without a net: U1 1 4 5 12 13 15 16 17

## Via types
v1: diameter 0.61, hole 0.305, Top Layer to Bottom Layer, 34 vias

## Routing (per net, layer and track width the routed paths; a pad name or vN(x,y) marks a point on that pad's centre or on a via; arc(x,y) is an arc through that point)
1V2: length 6.7
  Top Layer w0.508: C5.2 5.52,8.45 6.35,7.62 6.36,7.63 R6.2 9.02,6.21 C6.2
1V8: length 6.8
  Top Layer w0.508: C4.2 14.6,6.21 R3.2 17.28,7.63 17.97,8.32 C3.2
3V32: length 5.8
  Top Layer w0.508: C2.2 11.11,18.6 R1.2 13.15,18.28 13.21,18.23 15.22,18.23 L1.2
5V_IN: length 37.9
  Top Layer w0.508: 30.01,8.54 32.68,8.54 R20.2 ; 30.01,8.54 31.56,6.98 R19.2 33.4,6.36 33.4,5.72 33.91,5.21 U3.8 ; 30.01,8.54 22.45,8.54 ; 21.08,15.88 21.08,9.91 22.45,8.54 ; U3.4 29.48,1.4 28.07,1.4 27.85,1.61 C18.1 25.44,1.52 24.51,1.52 24,2.03 24,6.98 22.45,8.54
  vias: v1(1.02,14.22) v1(1.02,13.08) v1(2.29,14.22) v1(2.29,13.08) v1(17.9,20.44) v1(17.91,19.27) v1(17.91,18.12) v1(18.82,18.12) v1(18.84,20.44) v1(18.84,19.27)
GND: length 46.5
  Top Layer w0.508: 5.46,16.75 5.33,16.62 C9.1 C8.1 7.87,15.94 7.87,17.91 8.25,18.28 R2.1 9.71,18.34 C2.1 v1(6.6,20.07) v1(5.46,20.07) ; 5.46,16.75 v1(5.46,18.76) ; 5.46,16.75 6.6,17.89 v1(6.6,18.77) ; 27.34,6.22 28.47,6.22 U3.1 30.28,5.21 U3.9 31.54,2.67 U3.3 29.09,3.06 R18.1 26.94,3.61 C18.2 25.53,5.97 25.78,6.22 ; 27.34,6.22 27.37,6.25 v1(27.37,7.37) ; 27.34,6.22 25.78,6.22 ; v1(18.54,15.49) 18.54,14.16 C7.1 19.56,14.1 19.94,14.48 v1(19.94,15.49) ; 25.78,6.22 25.91,6.35 v1(25.91,7.37) ; 25.9,11.81 25.9,12.18 v1(27.05,13.34) ; R15.1 27.82,12.45 v1(28.7,13.34)
  vias: v1(11.82,4.28) v1(11.82,3.4) v1(12.06,12.83) v1(20.7,22.23) v1(20.68,21.15) v1(22.03,22.23) v1(22.03,21.15) v1(23.37,22.23) v1(23.37,21.08) v1(41.02,8.89) v1(41.78,8.89) v1(42.16,7.75) v1(43.14,7.75) v1(44.29,8.9)
VBAT: length 7.5
  Top Layer w0.508: U3.5 35.81,1.4 36.45,0.76 41.15,0.76 41.53,1.14 41.53,1.52
VIN: length 13.2
  Top Layer w0.508: R13.2 43.43,5.72 45.59,7.87 46.35,7.87 48.64,10.16 48.64,12.19 48.39,12.45 47.15,12.45 C15.2
EN: length 9
  Top Layer w0.254: 35.21,12.44 36.2,12.44 36.58,12.06 36.58,10.54 39.24,7.87 39.24,7.76 R14.2 R13.1
FB1: length 6.1
  Top Layer w0.203: U1.14 11.66,15.51 11.43,15.75 R1.1
  Top Layer w0.508: R2.2 R1.1 13.15,16.77 C1.1
FB2: length 6.3
  Top Layer w0.203: U1.3 12.06,9.77 R4.2
  Top Layer w0.508: C3.1 14.61,9.14 ; 14.61,9.14 12.71,9.14 R4.2 ; 14.61,9.14 R3.1
FB3: length 6.5
  Top Layer w0.203: U1.2 11.66,9.88 R5.2
  Top Layer w0.508: R5.2 R6.1 7.04,9.14 C5.1
FB4: length 14.6
  Top Layer w0.508: U2.4 25.41,9.9 24.38,10.92 24.38,11.82 ; 24.38,11.82 24.39,11.81 ; 24.38,11.82 24.38,14.23
$2N216: length 3.7
  Top Layer w0.508: U2.8 40.77,13.73 40.77,15.11 39.88,16 C10.1
$2N507: length 2.5
  Top Layer w0.508: U2.6 42.59,11.17 R12.2
$2N1682: length 1.8
  Top Layer w0.508: R15.2 31.18,11.81
$2N1720: length 2.9
  Top Layer w0.508: U2.3 33.94,11.17 33.3,11.81 C13.2
$2N3676: length 2.2
  Top Layer w0.508: U3.2 28.58,3.94 27.95,4.57 R18.2
$2N3989: length 1.6
  Top Layer w0.508: U3.7 36.41,3.94 LED1.1
$2N3992: length 3.6
  Top Layer w0.508: U3.6 36.06,2.67 36.58,2.16 38.19,2.16 LED2.1
$2N4031: length 3.3
  Top Layer w0.508: R19.1 35.81,6.98 36.45,6.35 LED1.2
$2N4070: length 7.5
  Top Layer w0.508: R20.1 36.19,8.64 37.97,6.86 37.97,4.15 LED2.2

## Copper pours and planes (outline as drawn; the poured copper is in the pictures)
1V2 on Top Layer: 4.7,11.18 5.92,11.18 5.92,9.42 4.7,9.42
1V2 on Top Layer: 0.51,6.34 9.02,6.34 9.02,0.51 0.51,0.51
1V8 on Top Layer: 17.55,10.8 18.92,10.8 18.92,8.69 17.55,8.69
1V8 on Top Layer: 14.57,6.22 23.24,6.22 23.24,0.51 14.57,0.51
3V32 on Top Layer: 5.59,23.12 12.7,23.12 12.7,19.69 5.59,19.69
5V_IN on Top Layer: 15.7,21.15 19.43,21.15 19.43,17.4 15.7,17.4
5V_IN on Top Layer: 17.53,18.63 27.69,18.63 27.69,15.37 17.53,15.37
5V_IN on Top Layer: 14.35,23.11 19.43,23.11 19.43,21.07 14.35,21.07
5V_IN on Top Layer: 16.38,18.67 19.43,18.67 19.43,13.34 16.38,13.34
5V_IN on Top Layer: 0.51,14.79 4.93,14.79 4.93,12.06 0.51,12.06
5V_IN on Top Layer: 4.83,14.48 10.84,14.48 10.84,12.33 4.83,12.33
5V_IN on Top Layer: 13.34,14.76 17.5,14.76 17.5,12.32 13.34,12.32
5V_IN on Bottom Layer: 0.38,23.05 19.56,23.05 19.56,12.06 0.38,12.06
GND on Top Layer: 19.81,22.99 36.19,22.99 36.19,19.3 19.81,19.3
GND on Top Layer: 35.46,22.99 51.56,22.99 51.56,15.75 35.46,15.75
GND on Top Layer: 44.07,16.26 53.21,16.26 53.21,0.51 44.07,0.51
GND on Top Layer: 39.71,11.53 47.84,11.53 47.84,7.2 39.71,7.2
GND on Top Layer: 9.8,4.9 13.82,4.9 13.82,2.92 9.8,2.92
GND on Top Layer: 9.8,8 13.84,8 13.84,4.89 9.8,4.89
GND on Bottom Layer: 12.83,15.88 20.45,15.88 20.45,12.32 12.83,12.32
GND on Bottom Layer: 36.58,12.95 45.09,12.95 45.09,7.2 36.58,7.2
GND on Bottom Layer: 7.74,16.26 13.1,16.26 13.1,12.32 7.74,12.32
GND on Bottom Layer: 26.13,13.84 29.34,13.84 29.34,12.95 26.13,12.95
GND on Bottom Layer: 20.32,15.89 38.99,15.89 38.99,10.8 20.32,10.8
GND on Bottom Layer: 13.84,9.72 43.27,9.72 43.27,2.93 13.84,2.93
GND on Bottom Layer: 5.21,15.24 13.97,15.24 13.97,2.92 5.21,2.92
GND on Bottom Layer: 4.72,20.7 8.76,20.7 8.76,15.24 4.72,15.24
GND on Bottom Layer: 19.69,22.99 24.38,22.99 24.38,15.88 19.69,15.88
GND on Bottom Layer: 40.83,20.57 51.66,20.57 51.66,9.02 40.83,9.02
VBAT on Top Layer: 39.75,4.7 43.43,4.7 43.43,1.27 39.75,1.27
VIN on Top Layer: 42.21,19.43 47.84,19.43 47.84,13.34 42.21,13.34
VIN on Top Layer: 39.75,13.34 47.84,13.34 47.84,11.97 39.75,11.97
SW1 on Top Layer: 12.83,16.54 16.35,16.54 16.35,14.04 12.83,14.04
SW2 on Top Layer: 13.29,12.1 16.69,12.1 16.69,10.29 13.29,10.29
SW3 on Top Layer: 6.85,12.13 10.85,12.13 10.85,10.39 6.85,10.39
SW4 on Top Layer: 29.87,18.42 37.82,18.42 37.82,13.46 29.87,13.46

Small or netless copper shapes (teardrops, artwork), in the pictures only: 1 on Top Layer

## Text on the board
Top Silkscreen Layer: VBAT | 3.3V | 5V | GND | 1.2V | 1.8V
